# Altium schematic sheet PG_Logic.SchDoc: =DocumentName
size A4; DocumentNumber: 1; Revision: 0; SheetNumber: 5; SheetTotal: 22
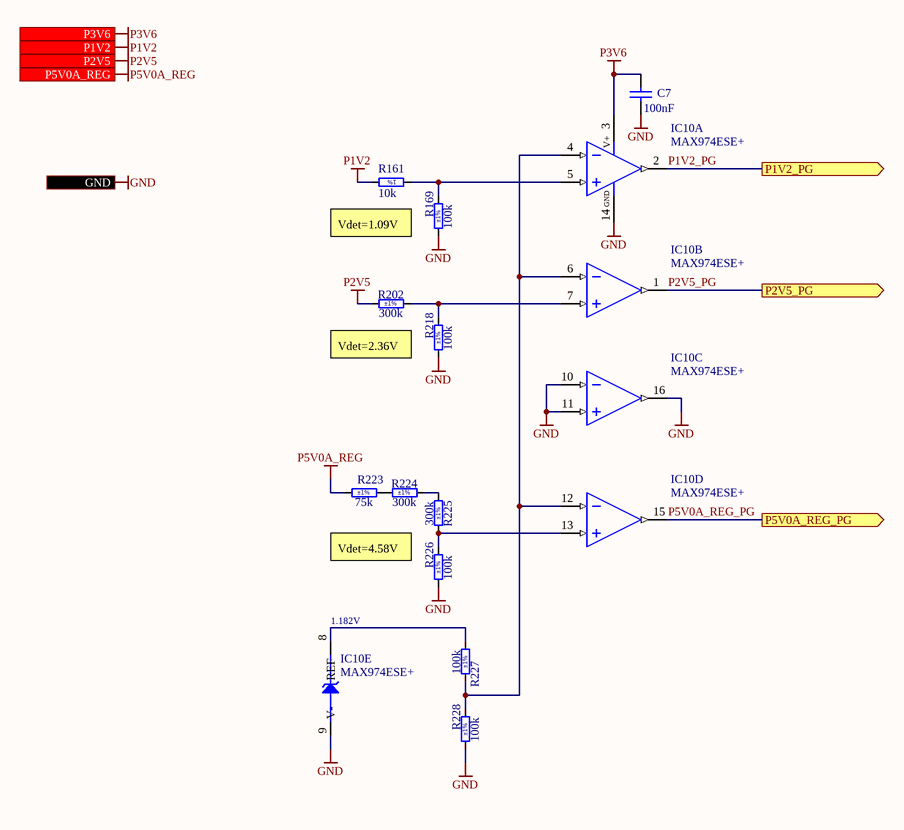
[diagram p0: PG_Logic.SchDoc]

## Parts
C7  100nF  [CAPC1005X55N]
IC10  MAX974ESE+  [SOIC127P600X175-16N]  (parts A,B,C,D,E of 5)
R161  10k  [RESC1005X40N]
R169  100k  Tolerance: ±1%  [RESC1005X40N]
R202  300k  Tolerance: ±1%  [RESC1005X40N]
R218  100k  Tolerance: ±1%  [RESC1005X40N]
R223  75k  Tolerance: ±1%  [RESC1005X40N]
R224  300k  Tolerance: ±1%  [RESC1005X40N]
R225  300k  Tolerance: ±1%  [RESC1005X40N]
R226  100k  Tolerance: ±1%  [RESC1005X40N]
R227  100k  Tolerance: ±1%  [RESC1005X40N]
R228  100k  Tolerance: ±1%  [RESC1005X40N]

## Ports
GND, P1V2 (in), P1V2_PG (out), P2V5 (in), P2V5_PG (out), P3V6 (in), P5V0A_REG (in), P5V0A_REG_PG (out)

## Nets
GND: C7.2 IC10.9(V-) IC10.10(INC-) IC10.11(INC+) IC10.14(GND) IC10.16(OUTC) R169.2 R218.2 R226.2 R228.2 ; port GND
P1V2: R161.1 ; port P1V2
P2V5: R202.1 ; port P2V5
P3V6: C7.1 IC10.3(V+) ; port P3V6
P5V0A_REG: R223.1 ; port P5V0A_REG
P1V2_PG: IC10.2(OUTA) ; port P1V2_PG
P2V5_PG: IC10.1(OUTB) ; port P2V5_PG
P5V0A_REG_PG: IC10.15(OUTD) ; port P5V0A_REG_PG
NetIC10_4: IC10.4(INA-) IC10.6(INB-) IC10.12(IND-) R227.1 R228.1
NetIC10_5: IC10.5(INA+) R161.2 R169.1
NetIC10_7: IC10.7(INB+) R202.2 R218.1
NetIC10_8: IC10.8(REF) R227.2
NetIC10_13: IC10.13(IND+) R225.2 R226.1
NetR223_2: R223.2 R224.1
NetR224_2: R224.2 R225.1

## Notes on the sheet
- Vdet=1.09V
- Vdet=2.36V
- Vdet=4.58V
- (near IC10) 1.182V
- Release
- Last modified =ModifiedDate
  Sheet =sheetnumber of =sheettotal · Size A4
- Copyright =P_copyright_owner
  This source describes Open Hardware and is licensed under the CERN-OHL-W v2. You may redistribute and modify this source and make products using it under the terms of the CERN-OHL-W v2 (https://cern.ch/cern-ohl). This source is distributed WITHOUT ANY EXPRESS OR IMPLIED WARRANTY, INCLUDING OF MERCHANTABILITY, SATISFACTORY QUALITY AND FITNESS FOR A PARTICULAR PURPOSE. Please see the CERN-OHL-W v2 for applicable conditions.
  Notice: If You produce hardware based on this source, You must maintain the Source Location visible on the product, its packaging or its documentation.
- SINARA OPEN HARDWARE
- OPEN HARDWARE FOR SCIENTIFIC INSTRUMENTATION
- https://github.com/sinara-hw
- Release owner
- Designers
- Reviewers
- Source location:
- (in symbol R0402_10K_1%_0.0625W_100PPM) 1%

## Library data of the parts
C7 = CC0402_100NF_50V_10%_X7R: Non-polarised capacitor; Part Description: SMD Multilayer Chip Ceramic Capacitor; Manufacturer: GENERIC; Manufacturer1 Part Number: GRM155R71H104KE14D; Voltage: 50V; TC: X7R; Tolerance: ±10%; Part Number: CC0402_100NF_50V_10%_X7R; Component Kind: Standard; Component Type: Standard; Pin Count: 2; Value: 100nF; Status: None; Manufacturer Part Number: CC0402_100NF_50V_10%_X7R; Case: 0402; Mounted: Yes; Socket: No; SMD: Yes; Sense: No; Manufacturer1 Example: MURATA; Manufacturer1 ComponentHeight: 0.55mm; HelpURL: \\cern.ch\dfs\Applications\Altium\Datasheets\CC0402_MURATA_GRM155R71H104KE14D.pdf; Author: CERN DEM MR; CreateDate: 30.06.2017; LatestRevisionDate: 30.06.2017
IC10 = CMP-016-00743-1: Op Amp, 8.5μA, Open Drain, 4-Ch, 11V, 10mV@5V, SOIC-16, SMD; Min Supply Voltage: 2.5V; Max Power Dissipation: 696mW; Pins: 16; Case/Package: SOIC; Mounting Technology: Surface Mount; Max Supply Voltage: 11V; Min Operating Temperature: -40°C; Max Operating Temperature: 85°C
R161 = R0402_10K_1%_0.0625W_100PPM: Resistor - 1%; Part Description: General Purpose Thick Film Chip Resistor; Manufacturer: GENERIC; Manufacturer1 Part Number: 232270671003L; TC: ±100ppm/°C; Part Number: R0402_10K_1%_0.0625W_100PPM; Component Kind: Standard; Component Type: Standard; Pin Count: 2; Value: 10k; Status: Not recommended; Power: 0.0625W; Tolerance: ±1%; Manufacturer Part Number: R0402_10K_1%_0.0625W_100PPM; Case: 0402; Mounted: Yes; Sense: No; Socket: No; SMD: Yes; Manufacturer1 Example: YAGEO PHYCOMP; Manufacturer1 ComponentHeight: 0.4mm; HelpURL: \\cern.ch\dfs\Applications\Altium\Datasheets\R0402_Phycomp_RC0402.pdf; Author: CERN DEM JLC; CreateDate: 03.12.2007; LatestRevisionDate: 17.10.2012
R169 R218 R226-R228 = R0402_100K_1%_0.0625W_100PPM: Resistor - 1%; Part Description: General Purpose Thick Film Chip Resistor; Manufacturer: GENERIC; Manufacturer1 Part Number: 232270671004L; TC: ±100ppm/°C; PressFit: No; Part Number: R0402_100K_1%_0.0625W_100PPM; Component Kind: Standard; Component Type: Standard; Pin Count: 2; Value: 100k; Status: Not Recommended; Power: 0.0625W; Manufacturer Part Number: R0402_100K_1%_0.0625W_100PPM; Case: 0402; Mounted: Yes; Sense: No; Socket: No; SMD: Yes; Manufacturer1 Example: YAGEO PHYCOMP; Manufacturer1 ComponentHeight: 0.4mm; HelpURL: \\cern.ch\dfs\Applications\Altium\Datasheets\R0402_Phycomp_RC0402.pdf; Author: CERN DEM JLC; CreateDate: 03.12.2007; LatestRevisionDate: 17.10.2012
R202 R224 R225 = R0402_300K_1%_0.0625W_100PPM: Resistor - 1%; Part Description: General Purpose Thick Film Chip Resistor; Manufacturer: GENERIC; Manufacturer1 Part Number: 232270673004L; TC: ±100ppm/°C; PressFit: No; Part Number: R0402_300K_1%_0.0625W_100PPM; Component Kind: Standard; Component Type: Standard; Pin Count: 2; Value: 300k; Status: Not Recommended; Power: 0.0625W; Manufacturer Part Number: R0402_300K_1%_0.0625W_100PPM; Case: 0402; Mounted: Yes; Sense: No; Socket: No; SMD: Yes; Manufacturer1 Example: YAGEO PHYCOMP; Manufacturer1 ComponentHeight: 0.4mm; HelpURL: \\cern.ch\dfs\Applications\Altium\Datasheets\R0402_Phycomp_RC0402.pdf; Author: CERN DEM JLC; CreateDate: 03.12.2007; LatestRevisionDate: 17.10.2012
R223 = R0402_75K_1%_0.0625W_100PPM: Resistor - 1%; Part Description: General Purpose Thick Film Chip Resistor; Manufacturer: GENERIC; Manufacturer1 Part Number: 232270677503L; TC: ±100ppm/°C; PressFit: No; Part Number: R0402_75K_1%_0.0625W_100PPM; Component Kind: Standard; Component Type: Standard; Pin Count: 2; Value: 75k; Status: Not Recommended; Power: 0.0625W; Manufacturer Part Number: R0402_75K_1%_0.0625W_100PPM; Case: 0402; Mounted: Yes; Sense: No; Socket: No; SMD: Yes; Manufacturer1 Example: YAGEO PHYCOMP; Manufacturer1 ComponentHeight: 0.4mm; HelpURL: \\cern.ch\dfs\Applications\Altium\Datasheets\R0402_Phycomp_RC0402.pdf; Author: CERN DEM JLC; CreateDate: 03.12.2007; LatestRevisionDate: 17.10.2012